# EAGLE schematic LIPOPROFIBAL06 (EAGLE 7.7.0)

## Sheet 1 of 5: CONTROL
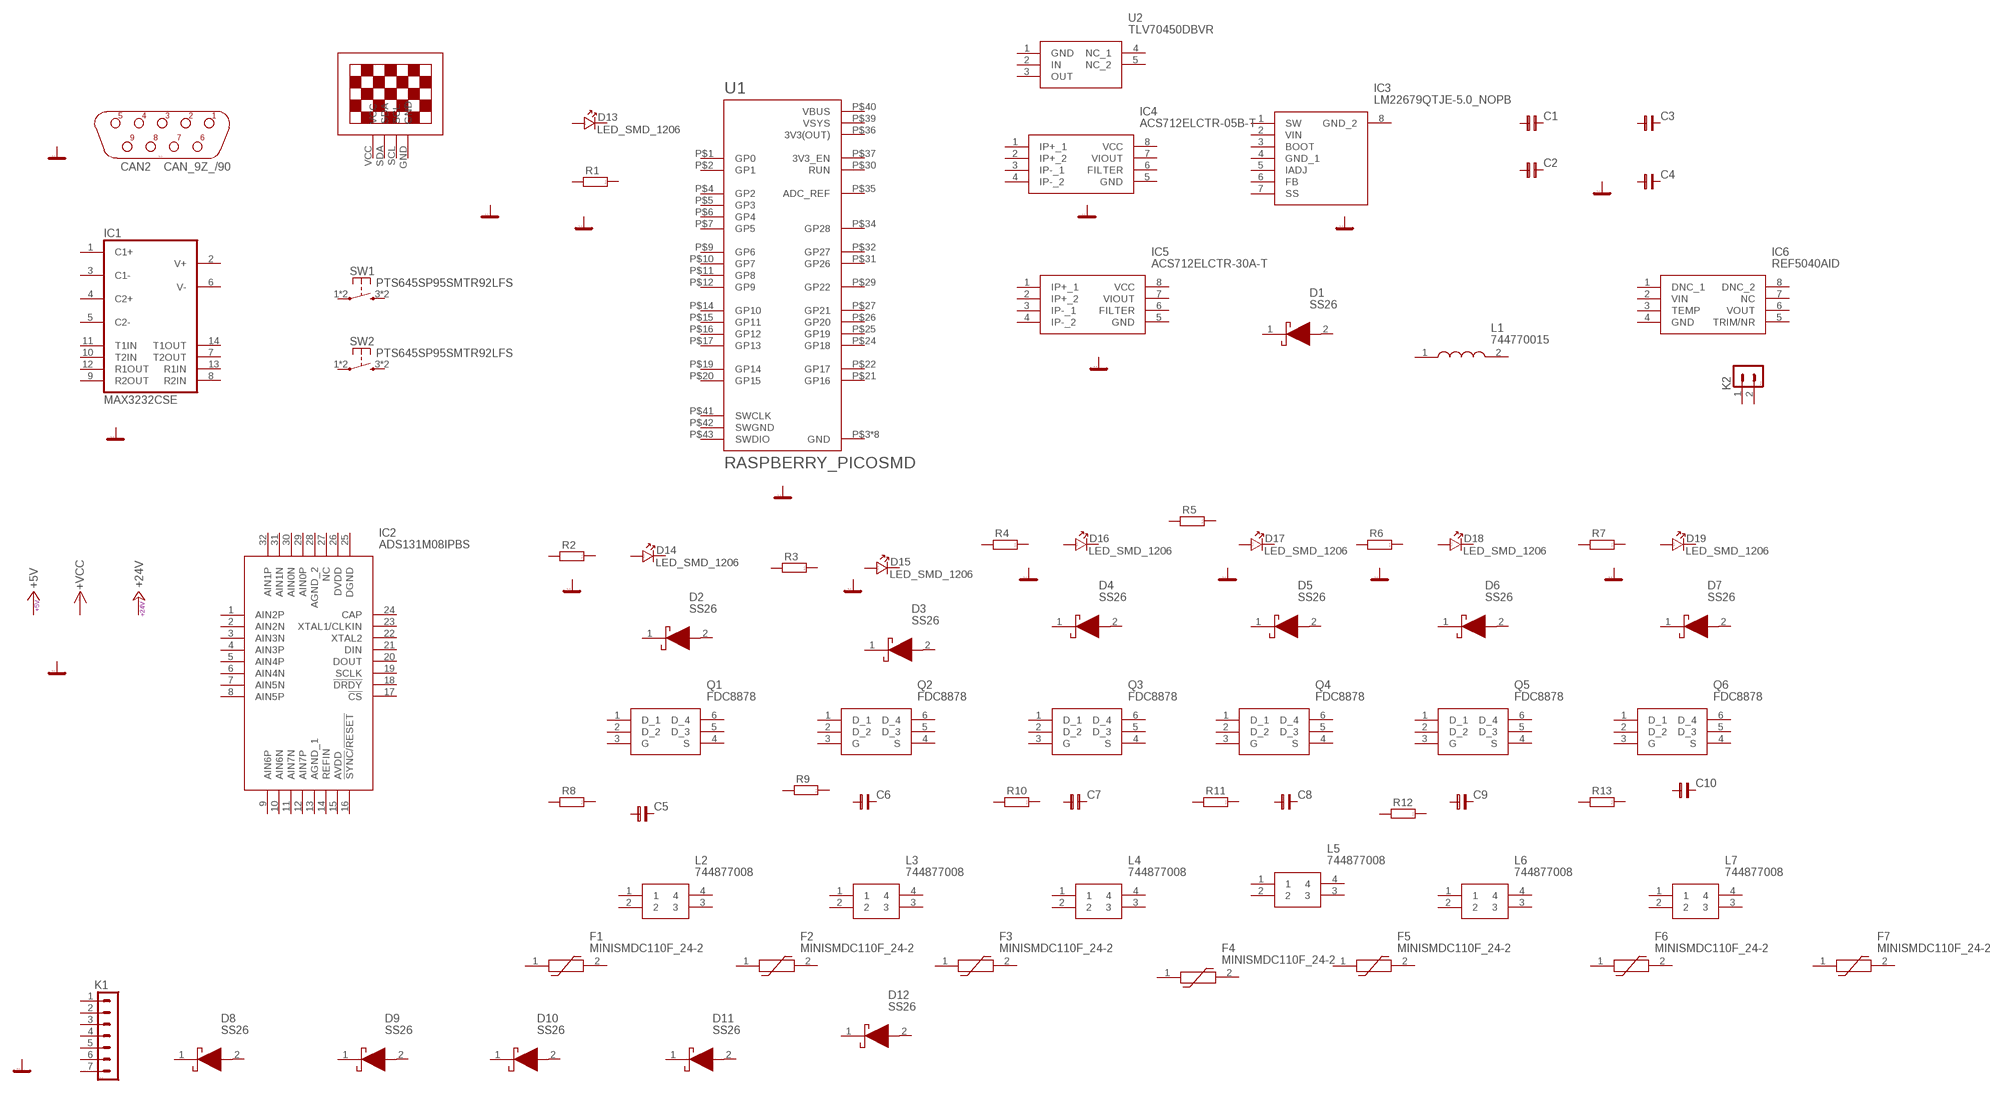
[diagram p0: schematic, sheet 1]

### Parts
C1  C-BP-SMD-SV-D  [SV-D]
C2  C-BP-SMD-SV-D  [SV-D]
C3  C-BP-SMD-SV-D  [SV-D]
C4  C-BP-SMD-SV-D  [SV-D]
C5  C-NP-SMD-1206  [C-1206]
C6  C-NP-SMD-1206  [C-1206]
C7  C-NP-SMD-1206  [C-1206]
C8  C-NP-SMD-1206  [C-1206]
C9  C-NP-SMD-1206  [C-1206]
C10  C-NP-SMD-1206  [C-1206]
CAN2  CAN_9Z_/90  [CAN9Z/90]
D1  SS26  [DIOM5336X265N]
D2  SS26  [DIOM5336X265N]
D3  SS26  [DIOM5336X265N]
D4  SS26  [DIOM5336X265N]
D5  SS26  [DIOM5336X265N]
D6  SS26  [DIOM5336X265N]
D7  SS26  [DIOM5336X265N]
D8  SS26  [DIOM5336X265N]
D9  SS26  [DIOM5336X265N]
D10  SS26  [DIOM5336X265N]
D11  SS26  [DIOM5336X265N]
D12  SS26  [DIOM5336X265N]
D13  LED_SMD_1206  [P1206]
D14  LED_SMD_1206  [P1206]
D15  LED_SMD_1206  [P1206]
D16  LED_SMD_1206  [P1206]
D17  LED_SMD_1206  [P1206]
D18  LED_SMD_1206  [P1206]
D19  LED_SMD_1206  [P1206]
F1  MINISMDC110F_24-2  [MINISMDC050F2]
F2  MINISMDC110F_24-2  [MINISMDC050F2]
F3  MINISMDC110F_24-2  [MINISMDC050F2]
F4  MINISMDC110F_24-2  [MINISMDC050F2]
F5  MINISMDC110F_24-2  [MINISMDC050F2]
F6  MINISMDC110F_24-2  [MINISMDC050F2]
F7  MINISMDC110F_24-2  [MINISMDC050F2]
IC1  MAX3232CSE  [SO16]
IC2  ADS131M08IPBS  [QFP50P700X700X120-32N]
IC3  LM22679QTJE-5.0_NOPB  [LM22678TJEADJNOPB]
IC4  ACS712ELCTR-05B-T  [SOIC127P600X175-8N]
IC5  ACS712ELCTR-30A-T  [SOIC127P600X175-8N]
IC6  REF5040AID  [SOIC127P600X175-8N]
K1  PSH02-07W  [PSH02-07W]
K2  PSH02-02W  [PSH02-02W]
L1  744770015  [WE-PD_1260/1245/1280/121054]
L2  744877008  [744877008]
L3  744877008  [744877008]
L4  744877008  [744877008]
L5  744877008  [744877008]
L6  744877008  [744877008]
L7  744877008  [744877008]
Q1  FDC8878  [SOT95P280X110-6N]
Q2  FDC8878  [SOT95P280X110-6N]
Q3  FDC8878  [SOT95P280X110-6N]
Q4  FDC8878  [SOT95P280X110-6N]
Q5  FDC8878  [SOT95P280X110-6N]
Q6  FDC8878  [SOT95P280X110-6N]
R1  R_SMD_1206  [1206]
R2  R_SMD_1206  [1206]
R3  R_SMD_1206  [1206]
R4  R_SMD_1206  [1206]
R5  R_SMD_1206  [1206]
R6  R_SMD_1206  [1206]
R7  R_SMD_1206  [1206]
R8  R_SMD_1206  [1206]
R9  R_SMD_1206  [1206]
R10  R_SMD_1206  [1206]
R11  R_SMD_1206  [1206]
R12  R_SMD_1206  [1206]
R13  R_SMD_1206  [1206]
SW1  PTS645SP95SMTR92LFS  [PTS645-SMDG]
SW2  PTS645SP95SMTR92LFS  [PTS645-SMDG]
U1  RASPBERRY_PICOSMD  [PICO-PKG-SMD]
U2  TLV70450DBVR  [SOT95P280X145-5N]
U$1  13"OLED13"OLED  [1.3"OLED]
Unconnected: C1.+ C1.- C2.+ C2.- C3.+ C3.- C4.+ C4.- C5.P$1 C5.P$2 C6.P$1 C6.P$2 C7.P$1 C7.P$2 C8.P$1 C8.P$2 C9.P$1 C9.P$2 C10.P$1 C10.P$2 CAN2.1 CAN2.2 CAN2.3 CAN2.4 CAN2.5 CAN2.6 CAN2.7 CAN2.8 CAN2.9 D1.1(K) D1.2(A) D2.1(K) D2.2(A) D3.1(K) D3.2(A) D4.1(K) D4.2(A) D5.1(K) D5.2(A) D6.1(K) D6.2(A) D7.1(K) D7.2(A) D8.1(K) D8.2(A) D9.1(K) D9.2(A) D10.1(K) D10.2(A) D11.1(K) D11.2(A) D12.1(K) D12.2(A) D13.A D13.K D14.A D14.K D15.A D15.K D16.A D16.K D17.A D17.K D18.A D18.K D19.A D19.K F1.1 F1.2 F2.1 F2.2 F3.1 F3.2 F4.1 F4.2 F5.1 F5.2 F6.1 F6.2 F7.1 F7.2 IC1.1(C1+) IC1.2(V+) IC1.3(C1-) IC1.4(C2+) IC1.5(C2-) IC1.6(V-) IC1.7(T2OUT) IC1.8(R2IN) IC1.9(R2OUT) IC1.10(T2IN) IC1.11(T1IN) IC1.12(R1OUT) IC1.13(R1IN) IC1.14(T1OUT) IC2.1(AIN2P) IC2.2(AIN2N) IC2.3(AIN3N) IC2.4(AIN3P) IC2.5(AIN4P) IC2.6(AIN4N) IC2.7(AIN5N) IC2.8(AIN5P) IC2.9(AIN6P) IC2.10(AIN6N) IC2.11(AIN7N) IC2.12(AIN7P) IC2.13(AGND_1) IC2.14(REFIN) IC2.15(AVDD) IC2.16(!SYNC!/!RESET) IC2.17(!CS) IC2.18(!DRDY) IC2.19(SCLK) IC2.20(DOUT) IC2.21(DIN) IC2.22(XTAL2) IC2.23(XTAL1/CLKIN) IC2.24(CAP) IC2.25(DGND) IC2.26(DVDD) IC2.27(NC) IC2.28(AGND_2) IC2.29(AIN0P) IC2.30(AIN0N) IC2.31(AIN1N) IC2.32(AIN1P) IC3.1(SW) IC3.2(VIN) IC3.3(BOOT) IC3.4(GND_1) IC3.5(IADJ) IC3.6(FB) IC3.7(SS) IC3.8(GND_2) IC4.1(IP+_1) IC4.2(IP+_2) IC4.3(IP-_1) IC4.4(IP-_2) IC4.5(GND) IC4.6(FILTER) IC4.7(VIOUT) IC4.8(VCC) IC5.1(IP+_1) IC5.2(IP+_2) IC5.3(IP-_1) IC5.4(IP-_2) IC5.5(GND) IC5.6(FILTER) IC5.7(VIOUT) IC5.8(VCC) IC6.1(DNC_1) IC6.2(VIN) IC6.3(TEMP) IC6.4(GND) IC6.5(TRIM/NR) IC6.6(VOUT) IC6.7(NC) IC6.8(DNC_2) K1.1 K1.2 K1.3 K1.4 K1.5 K1.6 K1.7 K2.1 K2.2 L1.1 L1.2 L2.1 L2.2 L2.3 L2.4 L3.1 L3.2 L3.3 L3.4 L4.1 L4.2 L4.3 L4.4 L5.1 L5.2 L5.3 L5.4 L6.1 L6.2 L6.3 L6.4 L7.1 L7.2 L7.3 L7.4 Q1.1(D_1) Q1.2(D_2) Q1.3(G) Q1.4(S) Q1.5(D_3) Q1.6(D_4) Q2.1(D_1) Q2.2(D_2) Q2.3(G) Q2.4(S) Q2.5(D_3) Q2.6(D_4) Q3.1(D_1) Q3.2(D_2) Q3.3(G) Q3.4(S) Q3.5(D_3) Q3.6(D_4) Q4.1(D_1) Q4.2(D_2) Q4.3(G) Q4.4(S) Q4.5(D_3) Q4.6(D_4) Q5.1(D_1) Q5.2(D_2) Q5.3(G) Q5.4(S) Q5.5(D_3) Q5.6(D_4) Q6.1(D_1) Q6.2(D_2) Q6.3(G) Q6.4(S) Q6.5(D_3) Q6.6(D_4) R1.1 R1.2 R2.1 R2.2 R3.1 R3.2 R4.1 R4.2 R5.1 R5.2 R6.1 R6.2 R7.1 R7.2 R8.1 R8.2 R9.1 R9.2 R10.1 R10.2 R11.1 R11.2 R12.1 R12.2 R13.1 R13.2 SW1.1(P) SW1.2(P) SW1.3(S) SW1.4(S) SW2.1(P) SW2.2(P) SW2.3(S) SW2.4(S) U1.P$1(GP0) U1.P$2(GP1) U1.P$4(GP2) U1.P$5(GP3) U1.P$6(GP4) U1.P$7(GP5) U1.P$9(GP6) U1.P$10(GP7) U1.P$11(GP8) U1.P$12(GP9) U1.P$14(GP10) U1.P$15(GP11) U1.P$16(GP12) U1.P$17(GP13) U1.P$19(GP14) U1.P$20(GP15) U1.P$21(GP16) U1.P$22(GP17) U1.P$24(GP18) U1.P$25(GP19) U1.P$26(GP20) U1.P$27(GP21) U1.P$29(GP22) U1.P$30(RUN) U1.P$31(GP26) U1.P$32(GP27) U1.P$34(GP28) U1.P$35(ADC_REF) U1.P$37(3V3_EN) U1.P$41(SWCLK) U1.P$43(SWDIO) U2.3(OUT) U2.4(NC_1) U2.5(NC_2) U$1.GND U$1.SCL U$1.SDA U$1.VCC

## Sheet 2 of 5: RS232

## Sheet 3 of 5: DC/DC POWER

## Sheet 4 of 5: READY SWITCH POWER

## Sheet 5 of 5: ENERGY TRANSFER

## Power pins joined to a net without a drawn wire
3V3(OUT): U1.P$36(3V3(OUT))
GND: IC1.15(GND) U1.P$3(GND) U1.P$8(GND) U1.P$13(GND) U1.P$18(GND) U1.P$23(GND) U1.P$28(GND) U1.P$33(GND) U1.P$38(GND) U2.1(GND)
IN: U2.2(IN)
SWGND: U1.P$42(SWGND)
VBUS: U1.P$40(VBUS)
VCC: IC1.16(VCC)
VSYS: U1.P$39(VSYS)

## Library data of the parts
C1-C4 = cap-pan40:C-BP: BIPOLAR ELECTROLYTIC
C5-C10 = cap-pan40:C-NP: NON-POLARIZED FILM/CHIP
CAN2 = #PaJa_konektory:CAN_9Z: Konektory CANNON - zasuvka - 9pinu
D1-D12 = SS26:SS26: Obsolete - 60 V, 2.0 A Schottky Rectifier Source: Datasheet <https://www.onsemi.com/download/data-sheet/pdf/SS26-D.PDF>; ARROW_PART_NUMBER: SS26; ARROW_PRICE-STOCK: https://www.arrow.com/en/products/ss26/on-semiconductor; DESCRIPTION: Obsolete - 60 V, 2.0 A Schottky Rectifier; HEIGHT: 2.65mm; MANUFACTURER_NAME: onsemi; MANUFACTURER_PART_NUMBER: SS26; MOUSER_PART_NUMBER: 512-SS26; MOUSER_PRICE-STOCK: https://www.mouser.co.uk/ProductDetail/onsemi-Fairchild/SS26?qs=2ONuHmP%2FXza9PIJ4xxWgFA%3D%3D
D13-D19 = #PaJa_30:LED: LED - jednobarevna
F1-F7 = MINISMDC110F_24-2:MINISMDC110F_24-2: PPTC 24V 1.1A-HD 40A MAX Source: Datasheet <https://componentsearchengine.com//MINISMDC110F_24-2.pdf>; DESCRIPTION: PPTC 24V 1.1A-HD 40A MAX; HEIGHT: mm; MANUFACTURER_NAME: LITTELFUSE; MANUFACTURER_PART_NUMBER: MINISMDC110F/24-2; MOUSER_PART_NUMBER: 650-MINISMDC110F/24; MOUSER_PRICE-STOCK: https://www.mouser.com/Search/Refine.aspx?Keyword=650-MINISMDC110F%2F24
IC1 = maxim:MAX3232*: True RS-232 Transceivers 3.0V to 5.5V, Low-Power up to 1Mbps, Using Four 0.1µF External Capacitors Source: http://pdfserv.maxim-ic.com/en/ds/MAX3222-MAX3241.pdf; MPN: MAX3232CSE; OC_FARNELL: 9725490; OC_NEWARK: 90C2890
IC2 = ADS131M08IPBS:ADS131M08IPBS: Analog to Digital Converters - ADC 24-bit, 32-kSPS, 8-channel, simultaneous-sampling, delta-sigma ADC 32-TQFP -40 to 125 Source: Datasheet <https://www.ti.com/lit/ds/symlink/ads131m08.pdf?ts=1622395964906&ref_url=https%3A%2F%2Fwww.ti.com%2Fproduct%2FADS131M08%3FHQS%3Dasc-dc-dac-dc_ads131m08-dspbs-pf-asc_adc_0to9_null_fp-wwe%26DCM%3Dyes%26dclid%3DCKrhlvL38fACFfaI2AUdXdYA->; ARROW_PART_NUMBER: ADS131M08IPBS; ARROW_PRICE-STOCK: https://www.arrow.com/en/products/ads131m08ipbs/texas-instruments.html?utm_currency=USD&region=asia; DESCRIPTION: Analog to Digital Converters - ADC 24-bit, 32-kSPS, 8-channel, simultaneous-sampling, delta-sigma ADC 32-TQFP -40 to 125; HEIGHT: 1.2mm; MANUFACTURER_NAME: Texas Instruments; MANUFACTURER_PART_NUMBER: ADS131M08IPBS; MOUSER_PART_NUMBER: 595-ADS131M08IPBS; MOUSER_PRICE-STOCK: https://www.mouser.co.uk/ProductDetail/Texas-Instruments/ADS131M08IPBS?qs=Cb2nCFKsA8pz0MtZHgGAxg%3D%3D
IC3 = LM22679QTJE-5.0_NOPB:LM22679QTJE-5.0_NOPB: 5A SIMPLE SWITCHER, Step-Down Voltage Regulator with Adjustable Soft-Start & Current Limit Source: Datasheet <http://www.ti.com/lit/gpn/lm22679-q1>; ARROW_PART_NUMBER: LM22679QTJE-5.0/NOPB; ARROW_PRICE-STOCK: https://www.arrow.com/en/products/lm22679qtje-5.0nopb/texas-instruments?utm_currency=USD&region=nac; DESCRIPTION: 5A SIMPLE SWITCHER, Step-Down Voltage Regulator with Adjustable Soft-Start & Current Limit; HEIGHT: 2mm; MANUFACTURER_NAME: Texas Instruments; MANUFACTURER_PART_NUMBER: LM22679QTJE-5.0/NOPB; MOUSER_PART_NUMBER: 595-LM22679QTJE50NPB; MOUSER_PRICE-STOCK: https://www.mouser.co.uk/ProductDetail/Texas-Instruments/LM22679QTJE-5.0-NOPB?qs=E2%2FxqS9xjzpoYIM189bjbg%3D%3D
IC4 = ACS712ELCTR-05B-T:ACS712ELCTR-05B-T: Fully Integrated, Hall-Effect-Based Linear Current Sensor IC with 2.1 kVRMS Voltage Isolation and a Low-Resistance Current Conductor Source: Datasheet <https://www.allegromicro.com/~/media/Files/Datasheets/ACS712-Datasheet.ashx>; ARROW_PART_NUMBER: ACS712ELCTR-05B-T; ARROW_PRICE-STOCK: https://www.arrow.com/en/products/acs712elctr-05b-t_1/allegro-microsystems.html?utm_currency=USD&region=nac; DESCRIPTION: Fully Integrated, Hall-Effect-Based Linear Current Sensor IC with 2.1 kVRMS Voltage Isolation and a Low-Resistance Current Conductor; HEIGHT: 1.75mm; MANUFACTURER_NAME: Allegro Microsystems; MANUFACTURER_PART_NUMBER: ACS712ELCTR-05B-T; MOUSER_PART_NUMBER: 250-712ELCTR05BT; MOUSER_PRICE-STOCK: https://www.mouser.co.uk/ProductDetail/Allegro-MicroSystems/ACS712ELCTR-05B-T?qs=pUKx8fyJudDs65Rkshv5ug%3D%3D
IC5 = ACS712ELCTR-30A-T:ACS712ELCTR-30A-T: Fully Integrated, Hall-Effect-Based Linear Current Sensor IC with 2.1 kVRMS Voltage Isolation and a Low-Resistance Current Conductor Source: Datasheet <https://www.allegromicro.com/-/media/files/datasheets/acs712-datasheet.ashx>; ARROW_PART_NUMBER: ACS712ELCTR-30A-T; ARROW_PRICE-STOCK: https://www.arrow.com/en/products/acs712elctr-30a-t_1/allegro-microsystems.html?utm_currency=USD&region=nac; DESCRIPTION: Fully Integrated, Hall-Effect-Based Linear Current Sensor IC with 2.1 kVRMS Voltage Isolation and a Low-Resistance Current Conductor; HEIGHT: 1.75mm; MANUFACTURER_NAME: Allegro Microsystems; MANUFACTURER_PART_NUMBER: ACS712ELCTR-30A-T; MOUSER_PART_NUMBER: 250-712ELCTR30AT; MOUSER_PRICE-STOCK: https://www.mouser.co.uk/ProductDetail/Allegro-MicroSystems/ACS712ELCTR-30A-T?qs=pUKx8fyJudCUnx4DKHyK4g%3D%3D
IC6 = REF5040AID:REF5040AID: Low Noise, Very Low Drift, Precision Series Voltage Reference Source: Datasheet <http://www.ti.com/lit/ds/symlink/ref5040.pdf>; ARROW_PART_NUMBER: REF5040AID; ARROW_PRICE-STOCK: https://www.arrow.com/en/products/ref5040aid/texas-instruments?utm_currency=USD&region=nac; DESCRIPTION: Low Noise, Very Low Drift, Precision Series Voltage Reference; HEIGHT: 1.75mm; MANUFACTURER_NAME: Texas Instruments; MANUFACTURER_PART_NUMBER: REF5040AID; MOUSER_PART_NUMBER: 595-REF5040AID; MOUSER_PRICE-STOCK: https://www.mouser.co.uk/ProductDetail/Texas-Instruments/REF5040AID?qs=xL7PkI2RoJ5%252B3RmzrC%2Fllw%3D%3D
K1 = #PaJa_konektory:PSH02-07: Konektory se zamkem - vidlice - 7pin
K2 = #PaJa_konektory:PSH02-02: Konektory se zamkem - vidlice - 2pin
L1 = 744770015:744770015: WE-PD SMT Shielded Power Inductor Size 1280; L = 1,5 H +/-30%; IR = 16,5 A; Isat = 19 A; RDC = 5 m Source: Datasheet <https://www.we-online.com/catalog/datasheet/744770015.pdf>; DESCRIPTION: WE-PD SMT Shielded Power Inductor Size 1280; L = 1,5 H +/-30%; IR = 16,5 A; Isat = 19 A; RDC = 5 m; HEIGHT: 4.5mm; MANUFACTURER_NAME: Wurth Elektronik; MANUFACTURER_PART_NUMBER: 744770015; MOUSER_PART_NUMBER: 710-744770015; MOUSER_PRICE-STOCK: https://www.mouser.co.uk/ProductDetail/Wurth-Elektronik/744770015?qs=E%2F%2FhvbtCqpNqXB44kA7rrw%3D%3D
L2-L7 = 744877008:744877008: SMT-Doppeldrossel WE-DD Typ "M" L=2x 8,2H; IN= 1,70A; RDC=0,110 Ohm Source: Datasheet <https://www.we-online.com/catalog/datasheet/744877008.pdf>; DESCRIPTION: SMT-Doppeldrossel WE-DD Typ "M" L=2x 8,2H; IN= 1,70A; RDC=0,110 Ohm; HEIGHT: 4.8mm; MANUFACTURER_NAME: Wurth Elektronik; MANUFACTURER_PART_NUMBER: 744877008; MOUSER_PART_NUMBER: 710-744877008; MOUSER_PRICE-STOCK: https://www.mouser.com/Search/Refine.aspx?Keyword=710-744877008
Q1-Q6 = FDC8878:FDC8878: RoHS Compliant ; Fast switching speed ; Max rDS(on) = 16 m at VGS = 10 V, ID = 8.0 A ; Max rDS(on) = 18 m at VGS = 4.5 V, ID = 7.5 A ; High performance trench technology for extremely low rDS(on) Source: Datasheet <https://www.onsemi.com/pub/Collateral/FDC8878-D.pdf>; ARROW_PART_NUMBER: FDC8878; ARROW_PRICE-STOCK: https://www.arrow.com/en/products/fdc8878/on-semiconductor?region=nac; DESCRIPTION: RoHS Compliant ; Fast switching speed ; Max rDS(on) = 16 m at VGS = 10 V, ID = 8.0 A ; Max rDS(on) = 18 m at VGS = 4.5 V, ID = 7.5 A ; High performance trench technology for extremely low rDS(on); HEIGHT: 1.1mm; MANUFACTURER_NAME: onsemi; MANUFACTURER_PART_NUMBER: FDC8878; MOUSER_PART_NUMBER: 512-FDC8878; MOUSER_PRICE-STOCK: https://www.mouser.co.uk/ProductDetail/onsemi-Fairchild/FDC8878?qs=XoSzFQ8izGZZSjCKBALa4g%3D%3D
R1-R13 = #PaJa_30:R: Rezistor
SW1 SW2 = buttons:PTS645*?LFS: Tactile Button Part name: PTS645«termination»«force»«height»«package»LFS (options not in this library omitted, see datasheet) Termination: S Straight Force: N 100gf L 130gf M 160gf H 200gf K 260gf P 320gf Height: 43 4.3mm 50 5.0mm 70 7.0mm 73 7.3mm (square plunger) 95 9.5mm Package: 2: PTH SMTR92: SMD/DFP JSMTR92: SMD/J-lead; MF: C&K; MPN: PTS645SP95SMTR92LFS
U1 = RpiPico:RASPBERRY_PICO: Raspberry Pi Pico
U2 = TLV70450DBVR:TLV70450DBVR: 24V Input Voltage, 150mA, Ultra-Low-Iq Low-Dropout (LDO) Regulators Source: Datasheet <http://www.ti.com/lit/gpn/tlv704>; ARROW_PART_NUMBER: TLV70450DBVR; ARROW_PRICE-STOCK: https://www.arrow.com/en/products/tlv70450dbvr/texas-instruments.html?utm_currency=USD&region=asia; DESCRIPTION: 24V Input Voltage, 150mA, Ultra-Low-Iq Low-Dropout (LDO) Regulators; HEIGHT: 1.45mm; MANUFACTURER_NAME: Texas Instruments; MANUFACTURER_PART_NUMBER: TLV70450DBVR; MOUSER_PART_NUMBER: 595-TLV70450DBVR; MOUSER_PRICE-STOCK: https://www.mouser.co.uk/ProductDetail/Texas-Instruments/TLV70450DBVR?qs=O1HRStiETCjnnzW1gs5MfA%3D%3D
U$1 = 13oled:13"OLED